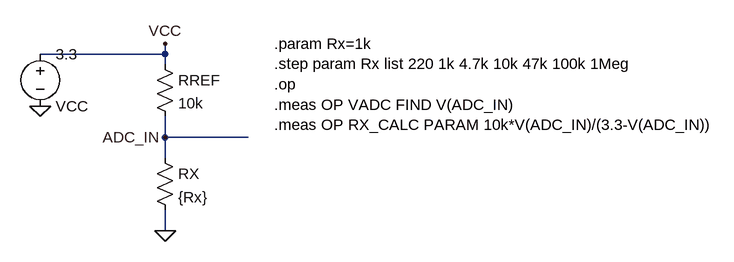
[diagram p0: schematic Resistor_Measurement_Verified.asc]
Resistor_Measurement_Verified.asc, the LTspice schematic file:
Version 4
SHEET 1 880 680
WIRE 352 96 352 64
WIRE 352 208 352 176
WIRE 352 208 480 208
WIRE 352 240 352 208
WIRE 352 352 352 320
FLAG 352 64 VCC
FLAG 352 208 ADC_IN
FLAG 352 352 0
SYMBOL res 336 80 R0
SYMATTR InstName RREF
SYMATTR Value 10k
SYMBOL res 336 224 R0
SYMATTR InstName RX
SYMATTR Value {Rx}
SYMBOL voltage 160 64 R0
WINDOW 0 24 96 Left 2
WINDOW 3 24 16 Left 2
SYMATTR InstName VCC
SYMATTR Value 3.3
WIRE 160 80 352 80
WIRE 352 80 352 64
FLAG 160 160 0
TEXT 520 64 Left 2 !.param Rx=1k\n.step param Rx list 220 1k 4.7k 10k 47k 100k 1Meg\n.op\n.meas OP VADC FIND V(ADC_IN)\n.meas OP RX_CALC PARAM 10k*V(ADC_IN)/(3.3-V(ADC_IN))

The netlist it stands for:
* Resistor_Measurement_Verified.asc
RREF VCC ADC_IN 10k
RX ADC_IN 0 {Rx}
VCC VCC 0 3.3
.param Rx=1k
.step param Rx list 220 1k 4.7k 10k 47k 100k 1Meg
.op
.meas OP VADC FIND V(ADC_IN)
.meas OP RX_CALC PARAM 10k*V(ADC_IN)/(3.3-V(ADC_IN))
.backanno
.end

* Results of the author's LTspice run, read from the files saved beside the schematic
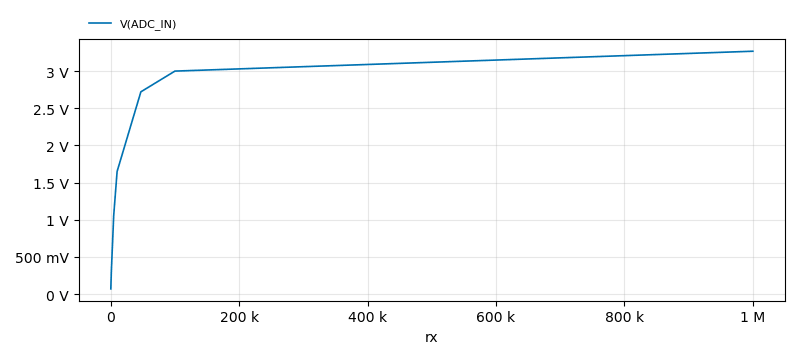
[diagram p1: Operating Point of Resistor_Measurement_Verified.asc, plotted from the saved traces]
* Operating Point, 1 run:
*   V(ADC_IN): 71.04 mV at rx=220 , 3.267 V at rx=1 M, min 71.04 mV, max 3.267 V
* From the log:
*   vadc: V(ADC_IN)=0.0710371807218 at 220
*   rx_calc: 10k*V(ADC_IN)/(3.3-V(ADC_IN))=1000003.06477